# Altium schematic sheet IBM_PC_ROM_BIOS.SchDoc
size A3; SheetNumber: 8; SheetTotal: 18
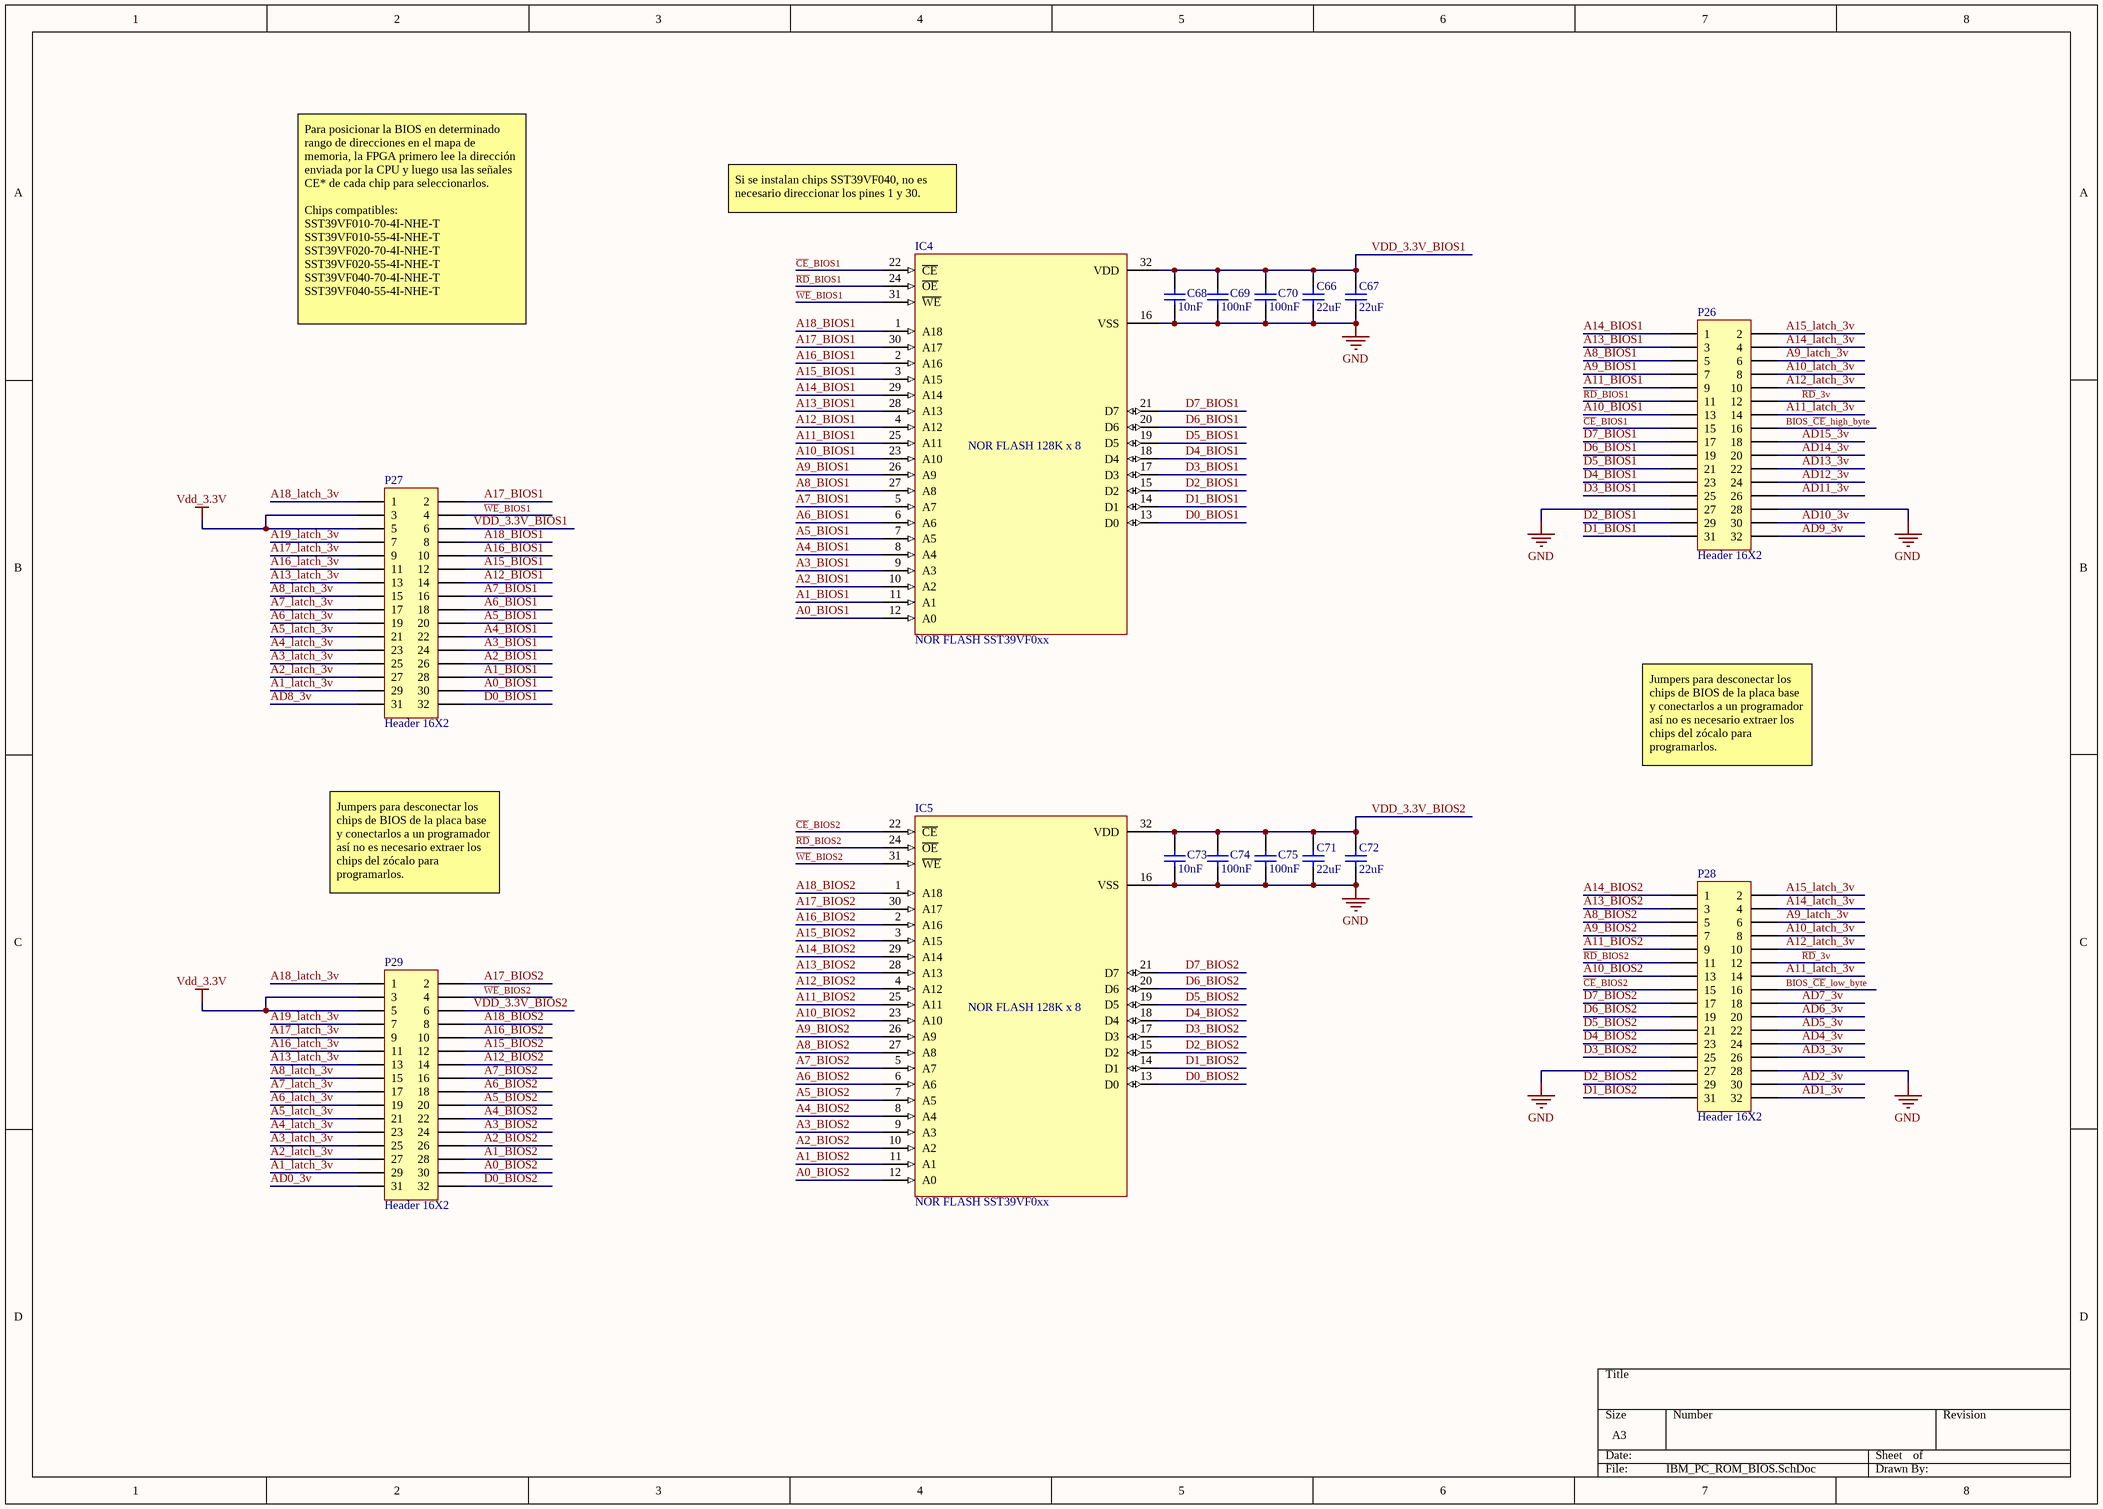
[diagram p0: IBM_PC_ROM_BIOS.SchDoc]

## Parts
C66  value 22uF  [capacitor 0603]  (hidden comment: ceramic capacitor)
C67  value 22uF  [capacitor 0603]  (hidden comment: ceramic capacitor)
C68  value 10nF  [capacitor 0603]  (hidden comment: Ceramic capacitor)
C69  value 100nF  [capacitor 0603]  (hidden comment: Ceramic capacitor)
C70  value 100nF  [capacitor 0603]  (hidden comment: Ceramic capacitor)
C71  value 22uF  [capacitor 0603]  (hidden comment: ceramic capacitor)
C72  value 22uF  [capacitor 0603]  (hidden comment: ceramic capacitor)
C73  value 10nF  [capacitor 0603]  (hidden comment: Ceramic capacitor)
C74  value 100nF  [capacitor 0603]  (hidden comment: Ceramic capacitor)
C75  value 100nF  [capacitor 0603]  (hidden comment: Ceramic capacitor)
IC4  NOR FLASH SST39VF0xx  [PLCC 32-pin]
IC5  NOR FLASH SST39VF0xx  [PLCC 32-pin]
P26  Header 16X2  [HDR2X16]
P27  Header 16X2  [HDR2X16]
P28  Header 16X2  [HDR2X16]
P29  Header 16X2  [HDR2X16]

## Nets
GND: C66.1 C67.1 C68.1 C69.1 C70.1 C71.1 C72.1 C73.1 C74.1 C75.1 IC4.16(VSS) IC5.16(VSS) P26.27 P26.28 P28.27 P28.28
Vdd_3.3V: P27.3 P27.5 P29.3 P29.5
A0_BIOS1: IC4.12(A0) P27.30
A0_BIOS2: IC5.12(A0) P29.30
A1_BIOS1: IC4.11(A1) P27.28
A1_BIOS2: IC5.11(A1) P29.28
A1_latch_3v: P27.29 P29.29
A2_BIOS1: IC4.10(A2) P27.26
A2_BIOS2: IC5.10(A2) P29.26
A2_latch_3v: P27.27 P29.27
A3_BIOS1: IC4.9(A3) P27.24
A3_BIOS2: IC5.9(A3) P29.24
A3_latch_3v: P27.25 P29.25
A4_BIOS1: IC4.8(A4) P27.22
A4_BIOS2: IC5.8(A4) P29.22
A4_latch_3v: P27.23 P29.23
A5_BIOS1: IC4.7(A5) P27.20
A5_BIOS2: IC5.7(A5) P29.20
A5_latch_3v: P27.21 P29.21
A6_BIOS1: IC4.6(A6) P27.18
A6_BIOS2: IC5.6(A6) P29.18
A6_latch_3v: P27.19 P29.19
A7_BIOS1: IC4.5(A7) P27.16
A7_BIOS2: IC5.5(A7) P29.16
A7_latch_3v: P27.17 P29.17
A8_BIOS1: IC4.27(A8) P26.5
A8_BIOS2: IC5.27(A8) P28.5
A8_latch_3v: P27.15 P29.15
A9_BIOS1: IC4.26(A9) P26.7
A9_BIOS2: IC5.26(A9) P28.7
A9_latch_3v: P26.6 P28.6
A10_BIOS1: IC4.23(A10) P26.13
A10_BIOS2: IC5.23(A10) P28.13
A10_latch_3v: P26.8 P28.8
A11_BIOS1: IC4.25(A11) P26.9
A11_BIOS2: IC5.25(A11) P28.9
A11_latch_3v: P26.14 P28.14
A12_BIOS1: IC4.4(A12) P27.14
A12_BIOS2: IC5.4(A12) P29.14
A12_latch_3v: P26.10 P28.10
A13_BIOS1: IC4.28(A13) P26.3
A13_BIOS2: IC5.28(A13) P28.3
A13_latch_3v: P27.13 P29.13
A14_BIOS1: IC4.29(A14) P26.1
A14_BIOS2: IC5.29(A14) P28.1
A14_latch_3v: P26.4 P28.4
A15_BIOS1: IC4.3(A15) P27.12
A15_BIOS2: IC5.3(A15) P29.12
A15_latch_3v: P26.2 P28.2
A16_BIOS1: IC4.2(A16) P27.10
A16_BIOS2: IC5.2(A16) P29.10
A16_latch_3v: P27.11 P29.11
A17_BIOS1: IC4.30(A17) P27.2
A17_BIOS2: IC5.30(A17) P29.2
A17_latch_3v: P27.9 P29.9
A18_BIOS1: IC4.1(A18) P27.8
A18_BIOS2: IC5.1(A18) P29.8
A18_latch_3v: P27.1 P29.1
A19_latch_3v: P27.7 P29.7
AD0_3v: P29.31
AD1_3v: P28.32
AD2_3v: P28.30
AD3_3v: P28.26
AD4_3v: P28.24
AD5_3v: P28.22
AD6_3v: P28.20
AD7_3v: P28.18
AD8_3v: P27.31
AD9_3v: P26.32
AD10_3v: P26.30
AD11_3v: P26.26
AD12_3v: P26.24
AD13_3v: P26.22
AD14_3v: P26.20
AD15_3v: P26.18
BIOS_~{CE}_high_byte: P26.16
BIOS_~{CE}_low_byte: P28.16
~{CE}_BIOS1: IC4.22(~{CE}) P26.15
~{CE}_BIOS2: IC5.22(~{CE}) P28.15
D0_BIOS1: IC4.13(D0) P27.32
D0_BIOS2: IC5.13(D0) P29.32
D1_BIOS1: IC4.14(D1) P26.31
D1_BIOS2: IC5.14(D1) P28.31
D2_BIOS1: IC4.15(D2) P26.29
D2_BIOS2: IC5.15(D2) P28.29
D3_BIOS1: IC4.17(D3) P26.25
D3_BIOS2: IC5.17(D3) P28.25
D4_BIOS1: IC4.18(D4) P26.23
D4_BIOS2: IC5.18(D4) P28.23
D5_BIOS1: IC4.19(D5) P26.21
D5_BIOS2: IC5.19(D5) P28.21
D6_BIOS1: IC4.20(D6) P26.19
D6_BIOS2: IC5.20(D6) P28.19
D7_BIOS1: IC4.21(D7) P26.17
D7_BIOS2: IC5.21(D7) P28.17
~{RD}_3v: P26.12 P28.12
~{RD}_BIOS1: IC4.24(~{OE}) P26.11
~{RD}_BIOS2: IC5.24(~{OE}) P28.11
VDD_3.3V_BIOS1: C66.2 C67.2 C68.2 C69.2 C70.2 IC4.32(VDD) P27.6
VDD_3.3V_BIOS2: C71.2 C72.2 C73.2 C74.2 C75.2 IC5.32(VDD) P29.6
~{WE}_BIOS1: IC4.31(~{WE}) P27.4
~{WE}_BIOS2: IC5.31(~{WE}) P29.4

## Notes on the sheet
- Si se instalan chips SST39VF040, no es necesario direccionar los pines 1 y 30.
- Para posicionar la BIOS en determinado rango de direcciones en el mapa de memoria, la FPGA primero lee la dirección enviada por la CPU y luego usa las señales CE* de cada chip para seleccionarlos.
  Chips compatibles:
  SST39VF010-70-4I-NHE-T
  SST39VF010-55-4I-NHE-T
  SST39VF020-70-4I-NHE-T
  SST39VF020-55-4I-NHE-T
  SST39VF040-70-4I-NHE-T
  SST39VF040-55-4I-NHE-T
- Jumpers para desconectar los chips de BIOS de la placa base y conectarlos a un programador así no es necesario extraer los chips del zócalo para programarlos.
- (in symbol NOR FLASH SST39VF0xx) NOR FLASH 128K x 8

## Library data of the parts
C66 C67 C71 C72 = ceramic capacitor: Multilayer ceramic capacitor; V: 6.3; LCSC part: C59461; Package: 0603
C68-C70 C73-C75 = Ceramic capacitor: Multilayer ceramic capacitor; V: 50; Package: 0603
  C68 C73: LCSC part: C1591
  C69 C70 C74 C75: LCSC part: C14663
IC4 IC5 = NOR FLASH SST39VF0xx: Parallel NOR FLASH SST39VF0xx
P26-P29 = Header 16X2: Header, 16-Pin, Dual row; LatestRevisionDate: 17-Jul-2002; LatestRevisionNote: Re-released for DXP Platform.; Publisher: Altium Limited